# Altium schematic sheet V1.SchDoc
size A; SheetNumber: 1; SheetTotal: 1
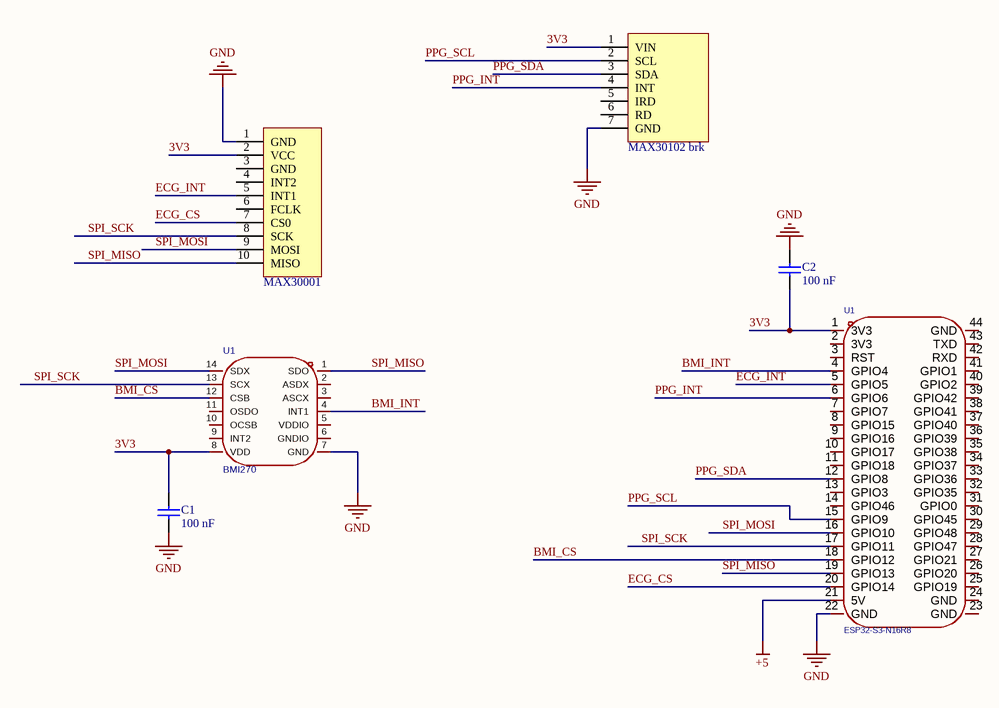
[diagram p0: V1.SchDoc]

## Parts
(Parts that share a designator on the sheet are numbered #1, #2 ... from top to bottom, then left to right.)
?#1  MAX30102 brk
?#2  MAX30001
C1  100 nF  [0805]
C2  100 nF  [0805]
U1#1  BMI270  [LGA-14_L3.0-W2.5-P0.50-BR]
U1#2  ESP32-S3-N16R8  [COMM-TH_ESP32-S3-DEVKITC-N16R8]

## Nets
+5: U1#2.21(5V)
GND: ?#1.7(GND) ?#2.1(GND) C1.1 C2.2 U1#1.7(GND) U1#2.22(GND)
3V3: ?#1.1(VIN) ?#2.2(VCC) C1.2 C2.1 U1#1.8(VDD) U1#2.1(3V3)
BMI_CS: U1#1.12(CSB) U1#2.18(GPIO12)
BMI_INT: U1#1.4(INT1) U1#2.4(GPIO4)
ECG_CS: ?#2.7(CS0) U1#2.20(GPIO14)
ECG_INT: ?#2.5(INT1) U1#2.5(GPIO5)
PPG_INT: ?#1.4(INT) U1#2.6(GPIO6)
PPG_SCL: ?#1.2(SCL) U1#2.15(GPIO9)
PPG_SDA: ?#1.3(SDA) U1#2.12(GPIO8)
SPI_MISO: ?#2.10(MISO) U1#1.1(SDO) U1#2.19(GPIO13)
SPI_MOSI: ?#2.9(MOSI) U1#1.14(SDX) U1#2.16(GPIO10)
SPI_SCK: ?#2.8(SCK) U1#1.13(SCX) U1#2.17(GPIO11)

Not connected (* = marked no-connect by the designer): ?#1 5(IRD) 6(RD); ?#2 3(GND) 4(INT2) 6(FCLK); U1#1 2(ASDX) 3(ASCX) 5(VDDIO) 6(GNDIO) 9(INT2) 10(OCSB) 11(OSDO); U1#2 2(3V3) 3(RST) 7(GPIO7) 8(GPIO15) 9(GPIO16) 10(GPIO17) 11(GPIO18) 13(GPIO3) 14(GPIO46) 23(GND) 24(GND) 25(GPIO19) 26(GPIO20) 27(GPIO21) 28(GPIO47) 29(GPIO48) 30(GPIO45) 31(GPIO0) 32(GPIO35) 33(GPIO36) 34(GPIO37) 35(GPIO38) 36(GPIO39) 37(GPIO40) 38(GPIO41) 39(GPIO42) 40(GPIO2) 41(GPIO1) 42(RXD) 43(TXD) 44(GND)

## Library data of the parts
?#1 = MAX30102 brk: Module PPG AFE; Parameter 1: *; Parameter 2: *
?#2 = MAX30001: ProtoCentral MAX30001 ECG and Respiration/Bio-Impedance Breakout Kit
C1 C2 = Cap 104_SMD: Capacitor (Semiconductor SIM Model); Value: 0.1uF; Published: 8-Jun-2000; LatestRevisionDate: 17-Jul-2002; LatestRevisionNote: Re-released for DXP Platform.; PackageReference: C1206; Publisher: Altium Limited
U1#1 = BMI270: Accelerometer Sensing Axis:X,Y,Z Acceleration Measurement Range (MAX):±16g Acceleration Measurement Range (MAX):±16g Gyroscope Sensing Axis:X,Y,Z Gyroscope Measurement Range (MAX):±2000dps Gyroscope Measurement Range (MAX):±2000dps Sensor Type:IMU (accele; Manufacturer: Bosch(博世); AddInBom: yes; ModelId: 4b7910fd5bff493b9fe87ff32c03dc44ÂŽ0819f05c4eef4c71ace90d822a990e87; ModelTransform: 118.11,98.425,0,180,0,0,-0.001,0.004,0; Accelerometer Sensing Axis: X,Y,Z; Acceleration Measurement Range (MAX): ±16g; Sensor Type: IMU (accelerometer + gyroscope); Output Bits: 16bit; Interface: I2C；SPI; Voltage - Supply: 1.71V~3.6V; Cache Size: 2KB; Standby Current: 3.5uA; Symbol: BMI270; Device: BMI270; LCSC Part Name: 6轴、智能、低功耗惯性测量单元，适用于高性能应用; SupplierPart: C2836813; ManufacturerPart: BMI270; Supplier Footprint: LGA-14(2.5x3); JLCPCB Part Class: Extended Part; Datasheet: https://item.szlcsc.com/datasheet/BMI270/3005172.html; Supplier: LCSC; ConvertToPcb: yes; FootprintName: LGA-14_L3.0-W2.5-P0.50-BR; ModelName: LGA-14_L3.0-W2.5-P0.50-BR; Gyroscope Sensing Axis: X,Y,Z; Gyroscope Measurement Range (MAX): ±2000dps; Operating Temperature: -40℃~+85℃; Features: Motion event detection；Synchronization and timestamp
U1#2 = ESP32-S3-N16R8: AddInBom: yes; Symbol: ESP32-S3-N16R8; Device: ESP32-S3-N16R8; LCSC Part Name: ESP32-S3-N16R8; SupplierPart: C9900309792; ManufacturerPart: ESP32-S3-N16R8; Supplier Footprint: 开发板; Supplier: LCSC; ConvertToPcb: yes; FootprintName: COMM-TH_ESP32-S3-DEVKITC-N16R8